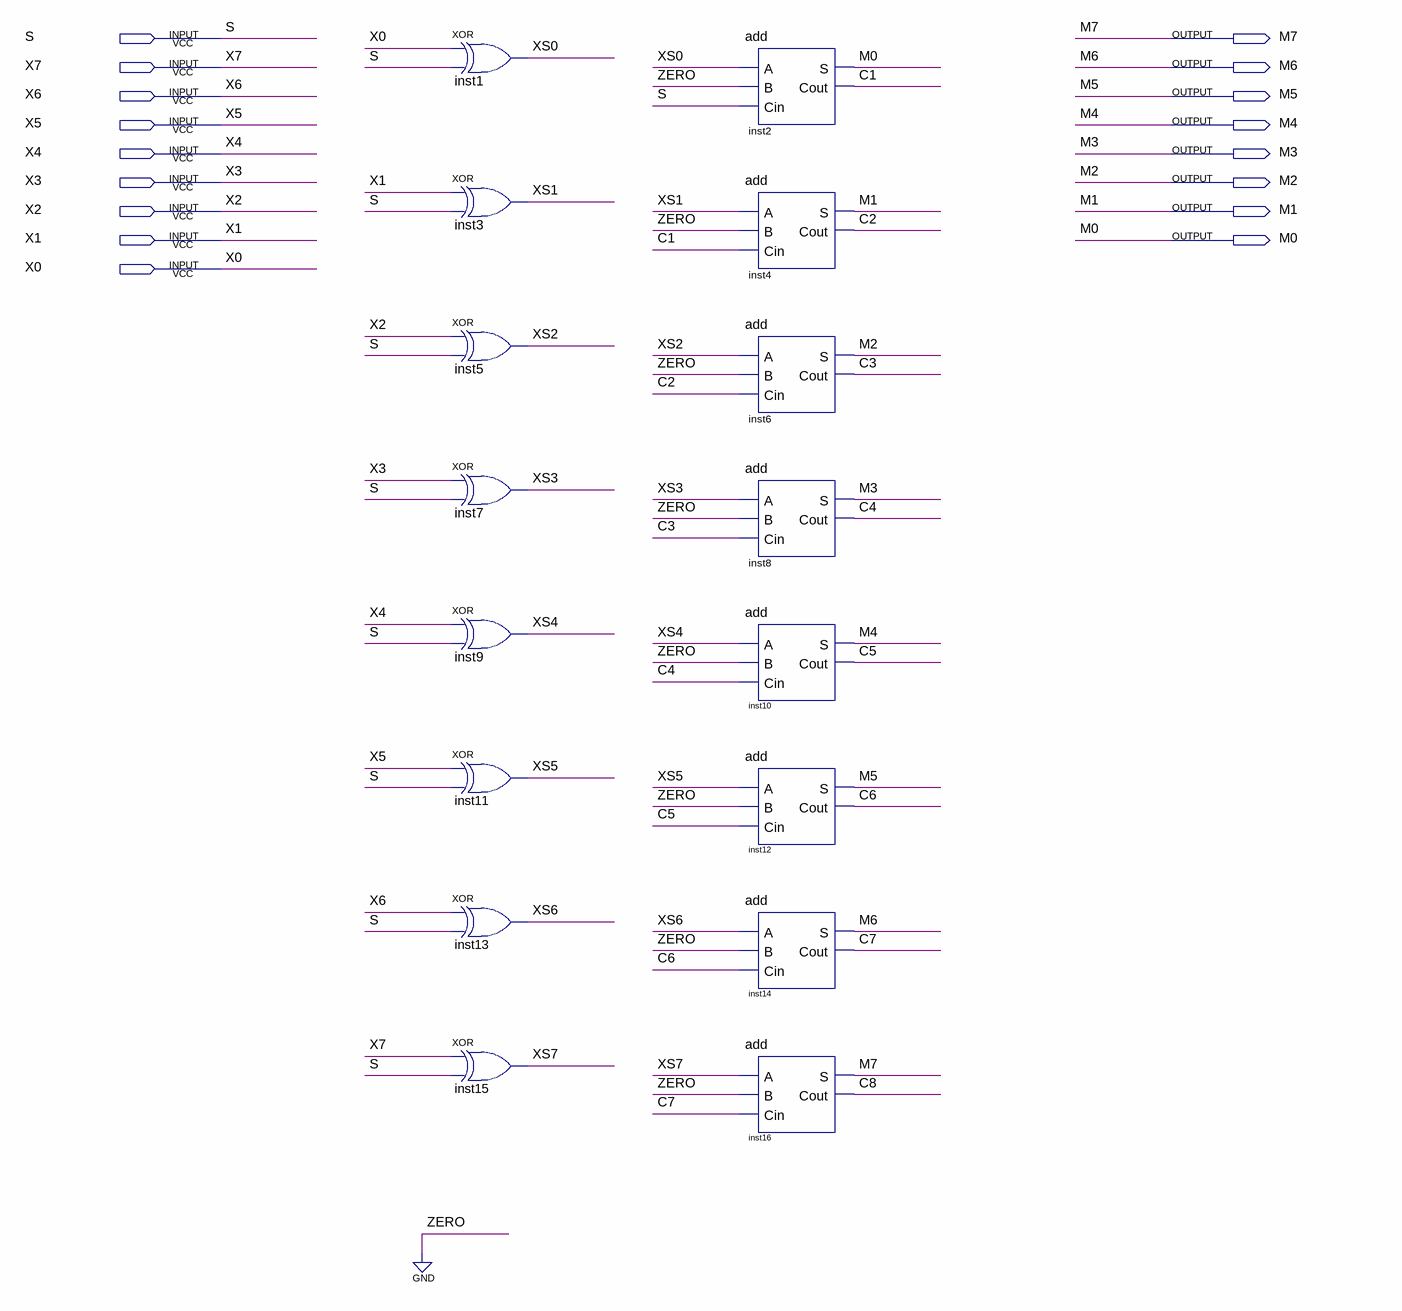
[diagram p0: schematic sheet]
// Quartus schematic abs8.bdf as structural Verilog: 16 symbols, 17 pins
module abs8 (
  input  S,
  input  X7,
  input  X6,
  input  X5,
  input  X4,
  input  X3,
  input  X2,
  input  X1,
  input  X0,
  output M7,
  output M6,
  output M5,
  output M4,
  output M3,
  output M2,
  output M1,
  output M0
);

  wire C1, C2, C3, C4, C5, C6, C7, C8, XS0, XS1, XS2, XS3, XS4, XS5, XS6, XS7;

  xor inst1 (XS0, X0, S);
  xor inst3 (XS1, X1, S);
  xor inst5 (XS2, X2, S);
  xor inst7 (XS3, X3, S);
  xor inst9 (XS4, X4, S);
  xor inst11 (XS5, X5, S);
  xor inst13 (XS6, X6, S);
  xor inst15 (XS7, X7, S);
  add inst2 (.A(XS0), .B(1'b0), .Cin(S), .S(M0), .Cout(C1));
  add inst4 (.A(XS1), .B(1'b0), .Cin(C1), .S(M1), .Cout(C2));
  add inst6 (.A(XS2), .B(1'b0), .Cin(C2), .S(M2), .Cout(C3));
  add inst8 (.A(XS3), .B(1'b0), .Cin(C3), .S(M3), .Cout(C4));
  add inst10 (.A(XS4), .B(1'b0), .Cin(C4), .S(M4), .Cout(C5));
  add inst12 (.A(XS5), .B(1'b0), .Cin(C5), .S(M5), .Cout(C6));
  add inst14 (.A(XS6), .B(1'b0), .Cin(C6), .S(M6), .Cout(C7));
  add inst16 (.A(XS7), .B(1'b0), .Cin(C7), .S(M7), .Cout(C8));
endmodule
